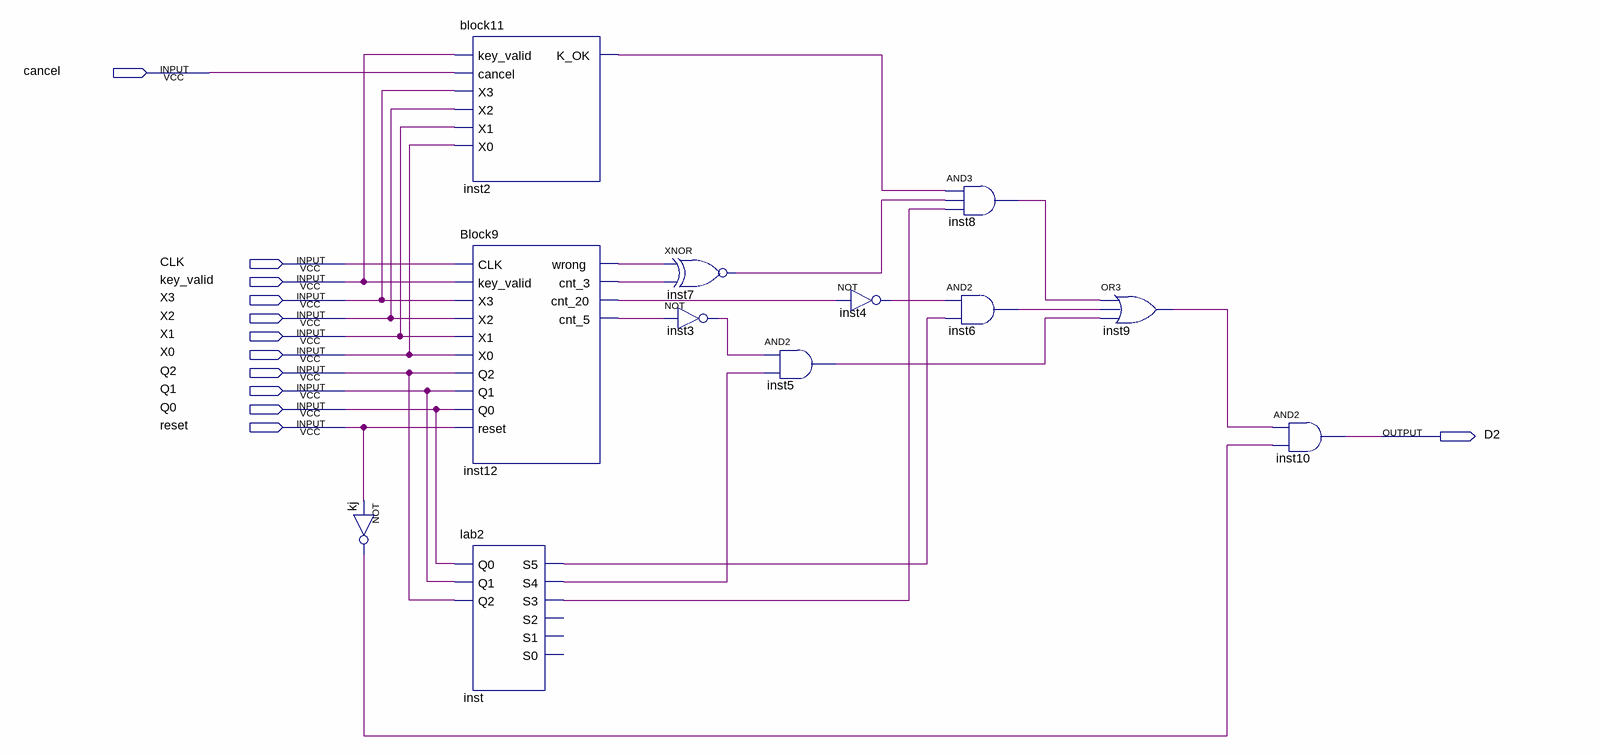
[diagram p0: schematic sheet]
// Quartus schematic block12.bdf as structural Verilog: 12 symbols, 12 pins
module block12 (
  input  cancel,
  input  CLK,
  input  key_valid,
  input  X3,
  input  X2,
  input  X1,
  input  X0,
  input  Q2,
  input  Q1,
  input  Q0,
  input  reset,
  output D2
);

  wire inst2_k_ok, inst3_out, inst4_out, inst5_out, inst6_out, inst7_out, inst8_out, inst9_out, inst12_cnt_3,
       inst12_cnt_5, inst12_cnt_20, inst12_wrong, inst_s3, inst_s4, inst_s5, kj_out;

  not kj (kj_out, reset);
  block11 inst2 (.key_valid(key_valid), .cancel(cancel), .X3(X3), .X2(X2), .X1(X1), .X0(X0), .K_OK(inst2_k_ok));
  Block9 inst12 (
    .CLK(CLK), .key_valid(key_valid), .X3(X3), .X2(X2), .X1(X1), .X0(X0), .Q2(Q2), .Q1(Q1), .Q0(Q0),
    .reset(reset), .wrong(inst12_wrong), .cnt_3(inst12_cnt_3), .cnt_20(inst12_cnt_20), .cnt_5(inst12_cnt_5));
  lab2 inst (.Q0(Q0), .Q1(Q1), .Q2(Q2), .S5(inst_s5), .S4(inst_s4), .S3(inst_s3));  // open: S2, S1, S0
  xnor inst7 (inst7_out, inst12_wrong, inst12_cnt_3);
  not inst3 (inst3_out, inst12_cnt_5);
  and inst5 (inst5_out, inst3_out, inst_s4);
  not inst4 (inst4_out, inst12_cnt_20);
  and inst8 (inst8_out, inst2_k_ok, inst7_out, inst_s3);
  and inst6 (inst6_out, inst4_out, inst_s5);
  or inst9 (inst9_out, inst8_out, inst6_out, inst5_out);
  and inst10 (D2, inst9_out, kj_out);
endmodule
